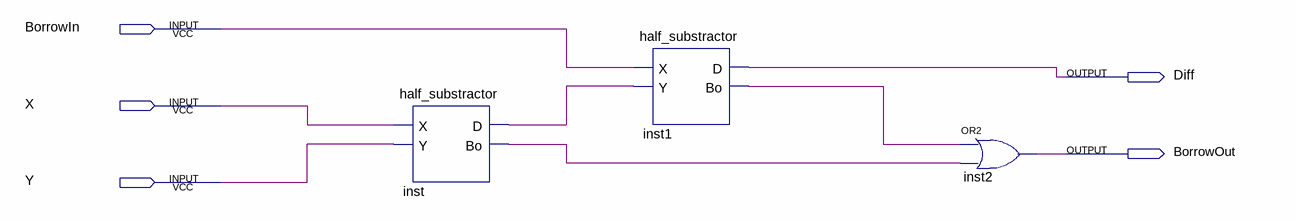
[diagram p0: schematic sheet]
// Quartus schematic Exp04b2.bdf as structural Verilog: 3 symbols, 5 pins
module Exp04b2 (
  input  BorrowIn,
  input  X,
  input  Y,
  output Diff,
  output BorrowOut
);

  wire inst1_bo, inst_bo, inst_d;

  half_substractor inst (.X(X), .Y(Y), .D(inst_d), .Bo(inst_bo));
  half_substractor inst1 (.X(BorrowIn), .Y(inst_d), .D(Diff), .Bo(inst1_bo));
  or inst2 (BorrowOut, inst1_bo, inst_bo);
endmodule
